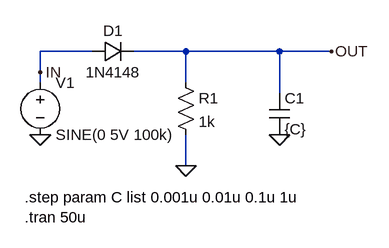
[diagram p0: schematic Example-7-3-a.asc]
Example-7-3-a.asc, the LTspice schematic file:
Version 4.1
SHEET 1 880 680
WIRE 192 32 112 32
WIRE 336 32 256 32
WIRE 480 32 336 32
WIRE 560 32 480 32
WIRE 112 64 112 32
WIRE 112 80 112 64
WIRE 336 80 336 32
WIRE 480 96 480 32
WIRE 336 208 336 160
FLAG 112 160 0
FLAG 336 208 0
FLAG 112 64 IN
FLAG 480 160 0
FLAG 560 32 OUT
SYMBOL voltage 112 64 R0
WINDOW 123 0 0 Left 0
WINDOW 39 0 0 Left 0
SYMATTR InstName V1
SYMATTR Value SINE(0 5V 100k)
SYMBOL diode 192 48 R270
WINDOW 0 32 32 VTop 2
WINDOW 3 0 32 VBottom 2
SYMATTR InstName D1
SYMATTR Value 1N4148
SYMBOL res 320 64 R0
SYMATTR InstName R1
SYMATTR Value 1k
SYMBOL cap 464 96 R0
SYMATTR InstName C1
SYMATTR Value {C}
TEXT 88 256 Left 2 !.step param C list 0.001u 0.01u 0.1u 1u\n.tran 50u

The netlist it stands for:
* Example-7-3-a.asc
V1 IN 0 SINE(0 5V 100k)
D1 IN OUT 1N4148
R1 OUT 0 1k
C1 OUT 0 {C}
.model D D
.lib standard.dio
.step param C list 0.001u 0.01u 0.1u 1u
.tran 50u
.backanno
.end

* Results of the author's LTspice run, read from the files saved beside the schematic
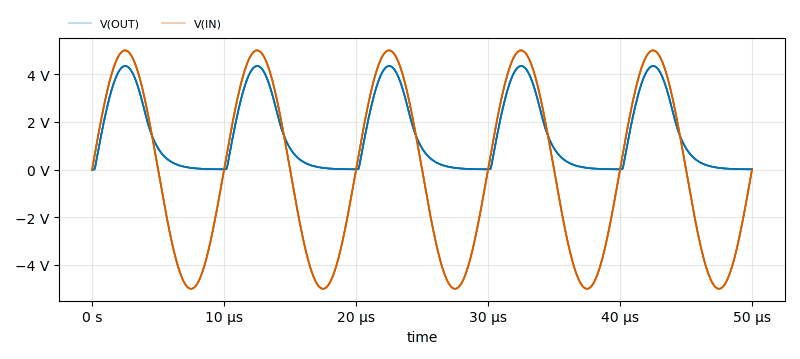
[diagram p1: Transient Analysis of Example-7-3-a.asc, plotted from the saved traces]
* Transient Analysis, 4 runs:
*   V(OUT) [c=1e-09]: min 0 V, max 4.346 V, average 1.432 V, rms 2.134 V, last 12.56 mV
*   V(OUT) [c=1e-08]: min 0 V, max 4.346 V, average 1.432 V, rms 2.134 V, last 12.56 mV
*   V(OUT) [c=1e-07]: min 0 V, max 4.346 V, average 1.432 V, rms 2.134 V, last 12.56 mV
*   V(OUT) [c=1e-06]: min 0 V, max 4.346 V, average 1.432 V, rms 2.134 V, last 12.56 mV
*   V(IN) [c=1e-09]: min -5 V, max 5 V, average 676.8 nV, rms 3.536 V, last 0 V
*   V(IN) [c=1e-08]: min -5 V, max 5 V, average 676.8 nV, rms 3.536 V, last 0 V
*   V(IN) [c=1e-07]: min -5 V, max 5 V, average 676.8 nV, rms 3.536 V, last 0 V
*   V(IN) [c=1e-06]: min -5 V, max 5 V, average 676.8 nV, rms 3.536 V, last 0 V